# Altium project Main_Board.PrjPcb (part 44 of 44)
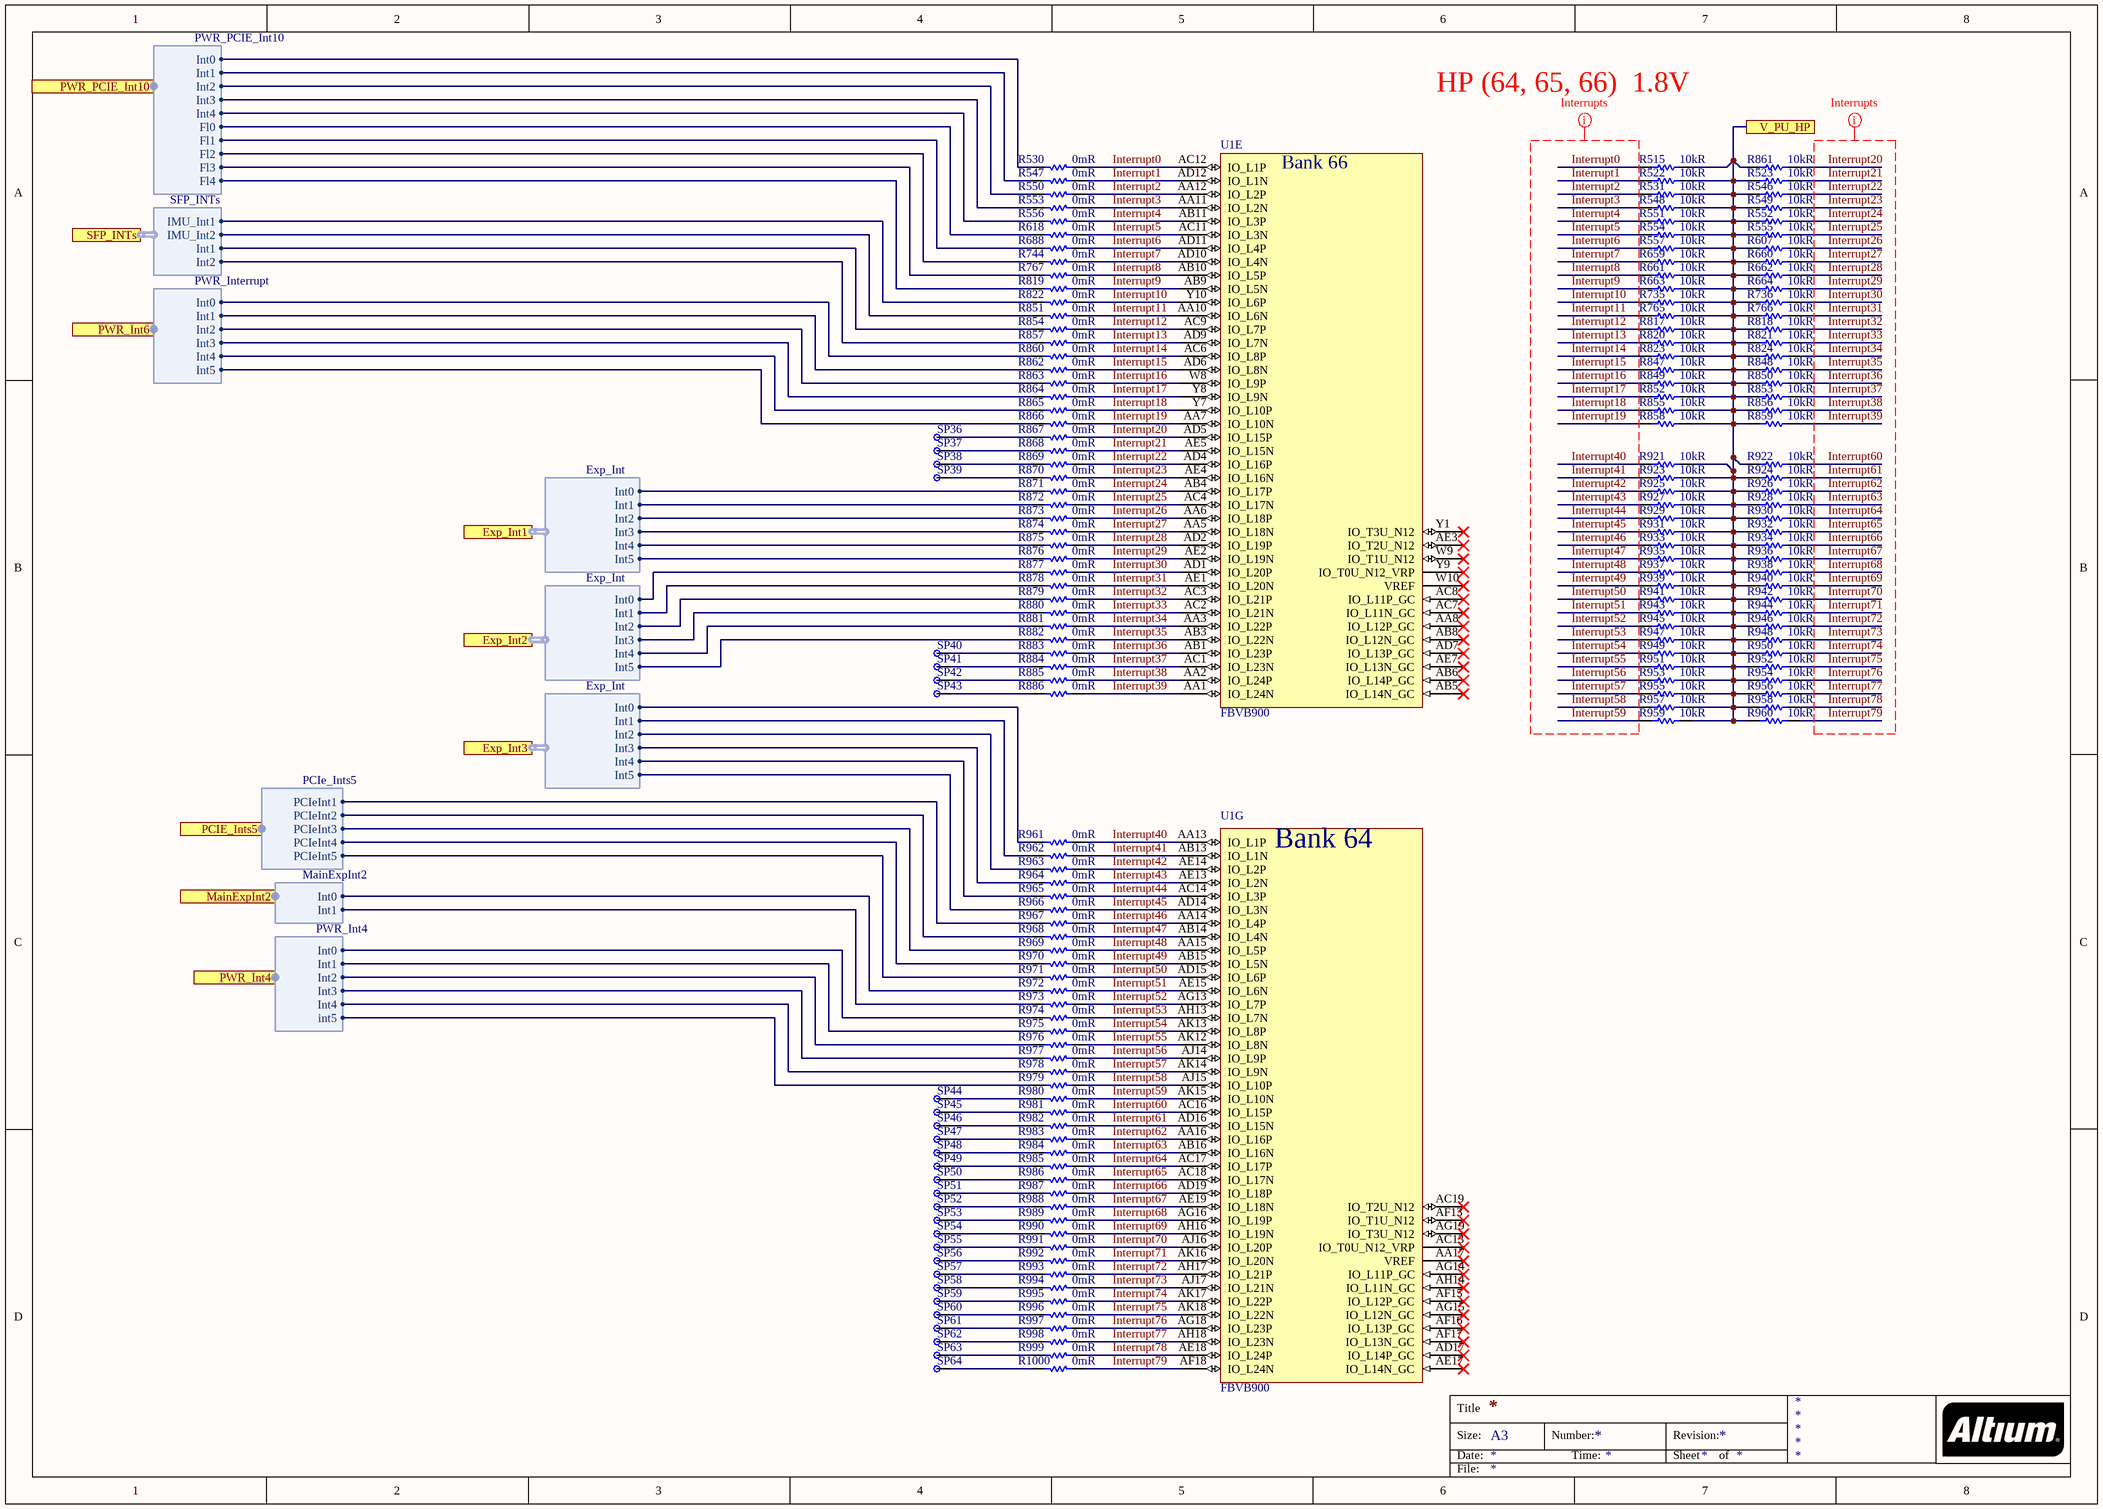
[diagram p71: US_Interrupts.SchDoc]

## Nets that join several sheets (continued)
NetR760_2: Expander_RESET (R760.2 R761.1), U_Expander_RESET/I2C_Expander_Main_Rst (U35_I2C_Expander_Main_Rst.12)
NetR762_2: Expander_RESET (R762.2 R763.1), U_Expander_RESET/I2C_Expander_Main_Rst (U35_I2C_Expander_Main_Rst.11)
NetR860_2: PowerDistribition/HiCurrent/U_Pomiar_pradu_napiecia_3 (U64_U_Pomiar_pradu_napiecia_3.3), US_Interrupts (R860.2)
NetR862_2: PowerDistribition/HiCurrent/U_Pomiar_pradu_napiecia_4 (U64_U_Pomiar_pradu_napiecia_4.3), US_Interrupts (R862.2)
NetR863_2: PowerDistribition/HiCurrent/U_Pomiar_pradu_napiecia_5 (U64_U_Pomiar_pradu_napiecia_5.3), US_Interrupts (R863.2)
NetR864_2: PowerDistribition/HiCurrent/U_Pomiar_pradu_napiecia_6 (U64_U_Pomiar_pradu_napiecia_6.3), US_Interrupts (R864.2)
NetR865_2: Power_Hi_Curr (U18.A3), US_Interrupts (R865.2)
NetR866_2: Pomiar_napiecia_high_curr (U72.3), US_Interrupts (R866.2)
NetR918_2: Ultrascale+_02 (R918.2), Trans_LS_I2C0 (U36_Trans_LS_I2C0.8)
NetR919_2: Ultrascale+_02 (R919.2), Trans_LS_I2C1 (U36_Trans_LS_I2C1.8)
NetSP12_I2C_Bridge_GPIO_1: Ext_GPIO/I2C_Bridge_GPIO (SP12_I2C_Bridge_GPIO.1 U3_I2C_Bridge_GPIO.24), U_Expander_RESET/I2C_Expander_Main_Rst (U35_I2C_Expander_Main_Rst.3)
NetU24_SPI_bridge_Main_12: HighSpeed/SPI_bridge_PCIe (5 pins), SPI_bridge_Main (U24_SPI_bridge_Main.12)
NetU24_SPI_bridge_Main_13: HighSpeed/SPI_bridge_PCIe (5 pins), SPI_bridge_Main (U24_SPI_bridge_Main.13)
NetU24_SPI_bridge_Main_14: HighSpeed/SPI_bridge_PCIe (5 pins), SPI_bridge_Main (U24_SPI_bridge_Main.14)
NVMe_Rx_0_N: Sata (J27.47 R541.2), GTR (C677.2)
NVMe_Rx_0_P: Sata (J27.49 R541.1), GTR (C653.2)
NVMe_Rx_1_N: Sata (J27.35 R542.1), GTR (C716.2)
NVMe_Rx_1_P: Sata (J27.37 R542.2), GTR (C715.2)
NVMe_Tx_0_N: Sata (J27.41), GTR (C651.2)
NVMe_Tx_0_P: Sata (J27.43), GTR (C649.2)
NVMe_Tx_1_N: Sata (J27.29), GTR (C718.2)
NVMe_Tx_1_P: Sata (J27.31), GTR (C717.2)
OSC_500Out: System_CLK (TP20.1), DAC (X2.10), CLK_Mux (C333.1)
P4HS_PowerAlert_Pcie0: HighSpeed/Power4HighSpeed/U_Pomiar_pradu_napiecia_PCIe0 (U64_U_Pomiar_pradu_napiecia_PCIe0.3), US_Interrupts (R530.2)
P4HS_PowerAlert_Pcie1: HighSpeed/Power4HighSpeed/U_Pomiar_pradu_napiecia_PCIe1 (U64_U_Pomiar_pradu_napiecia_PCIe1.3), US_Interrupts (R547.2)
P4HS_PowerAlert_Pcie2: HighSpeed/Power4HighSpeed/U_Pomiar_pradu_napiecia_PCIe2 (U64_U_Pomiar_pradu_napiecia_PCIe2.3), US_Interrupts (R550.2)
P4HS_PowerAlert_Pcie3: HighSpeed/Power4HighSpeed/U_Pomiar_pradu_napiecia_PCIe3 (U64_U_Pomiar_pradu_napiecia_PCIe3.3), US_Interrupts (R553.2)
P4HS_PowerAlert_Pcie4: HighSpeed/Power4HighSpeed/U_Pomiar_pradu_napiecia_PCIe4 (U64_U_Pomiar_pradu_napiecia_PCIe4.3), US_Interrupts (R556.2)
PCIe_RESET: Ultrascale+_01 (R788.1 TP35.1), Sata (J27.50)
PG1_1: Power_Distribution (R835.1), Power_ADP1850_Dual (R295.2 U37.27)
PG1_2: Power_Distribution (R838.1), Power_ADP1850_Dual_1 (R313.2 U38.27)
PG1_TPS7A8801: TPS7A88_5V_Dual_3.3V_3.3V (R440.2 U61.17), PowerDistribition/Zasilanie CLK/I2C_Expander_PWR_CLK (U35_I2C_Expander_PWR_CLK.28)
PG2_2: Power_Distribution (R836.1), Power_ADP1850_Dual_1 (R314.2 U38.14)
PG2_TPS7A8801: TPS7A88_5V_Dual_3.3V_3.3V (R441.2 U61.9), PowerDistribition/Zasilanie CLK/I2C_Expander_PWR_CLK (U35_I2C_Expander_PWR_CLK.1)
PG2_TPS7A8801_0V9: Power_ADP1850_Dual (U37.8), TPS7A88_3V3_1V8_0V9V@2x1A (R676.2 U70.9), ST1L08_5V_0V6 (U73.5), Power_LED (T33.1)
PG_2V5@1.5A: Power_Hi_Curr (U18.A2), Power_Ethernet (R392.1 U49.5), Power_LED (T38.1)
PG_3V3@14A_EXP: Power_Distribution (R835.2 R837.1), PowerDistribition/I2C_Expander_PWR_Dist (U35_I2C_Expander_PWR_Dist.25), Power_LED (T37.1)
PG_5V@10A_EXP: Power_Distribution (R836.2 R839.1), PowerDistribition/I2C_Expander_PWR_Dist (U35_I2C_Expander_PWR_Dist.26), Power_LED (T41.1)
PG_12@8A_EXP: Power_Distribution (R838.2 R840.1), PowerDistribition/I2C_Expander_PWR_Dist (U35_I2C_Expander_PWR_Dist.27), Power_LED (T45.1)
PG_48_20V: PowerDistribition/I2C_Expander_PWR_Dist (U35_I2C_Expander_PWR_Dist.4), Power_48_20V@3A (U65.19), Power_LED (T49.1), GPIO_I2C (R828.2)
PG_ADP1850_1V2_REG4: ADP1741_3V3_0V85 (R435.1 R668.1 U69.4), Power_LED (T40.1)
PG_LT3042: LT3042_12V_5V_LNLDO (R442.1 U62.4), PowerDistribition/Zasilanie CLK/I2C_Expander_PWR_CLK (U35_I2C_Expander_PWR_CLK.25), Power_LED (R1082.1)
PG_PS_LTC6952_1: PowerDistribition/Zasilanie CLK/5to3V3_1 (R431_5to3V3_1.1 U59_5to3V3_1.5), PowerDistribition/Zasilanie CLK/I2C_Expander_PWR_CLK (U35_I2C_Expander_PWR_CLK.17), Power_LED (T32.1)
PG_PS_LTC6952_2: PowerDistribition/Zasilanie CLK/5to3V3_2 (R431_5to3V3_2.1 U59_5to3V3_2.5), PowerDistribition/Zasilanie CLK/I2C_Expander_PWR_CLK (U35_I2C_Expander_PWR_CLK.21), Power_LED (T47.1)
PGND: Power_48_20V@3A (17 pins), RJ45 (D3.2 D4.2 R324.1)
Power1_In: Power_Distribution (P8.1), PowerDistribition/U_Pomiar_pradu_napiecia_1 (R448_U_Pomiar_pradu_napiecia_1.1 U64_U_Pomiar_pradu_napiecia_1.10)
Power1_In_CM: Power_Switch (9 pins), PowerDistribition/U_Pomiar_pradu_napiecia_1 (R448_U_Pomiar_pradu_napiecia_1.2 U64_U_Pomiar_pradu_napiecia_1.8 U64_U_Pomiar_pradu_napiecia_1.9)
Power2_In: Power_Distribution (P10.1), PowerDistribition/U_Pomiar_pradu_napiecia_2 (R448_U_Pomiar_pradu_napiecia_2.1 U64_U_Pomiar_pradu_napiecia_2.10)
Power2_In_CM: Power_Switch (9 pins), PowerDistribition/U_Pomiar_pradu_napiecia_2 (R448_U_Pomiar_pradu_napiecia_2.2 U64_U_Pomiar_pradu_napiecia_2.8 U64_U_Pomiar_pradu_napiecia_2.9)
Power_3.3_1: Zasilanie_CLKDistribution (20 pins), TPS7A88_5V_Dual_3.3V_3.3V (6 pins)
Power_3.3_2: Zasilanie_CLKDistribution (10 pins), TPS7A88_5V_Dual_3.3V_3.3V (6 pins)
Power_MUX_Status0: Power_Switch (R630.2 U5.9), PowerDistribition/I2C_Expander_PWR_Dist (U35_I2C_Expander_PWR_Dist.22)
Power_MUX_Status1: Power_Switch (R11.1 U4.9), PowerDistribition/I2C_Expander_PWR_Dist (U35_I2C_Expander_PWR_Dist.23)
Power_MUX_Status2: Power_Switch (R13.2 U48.9), PowerDistribition/I2C_Expander_PWR_Dist (U35_I2C_Expander_PWR_Dist.24)
PS_MODE1: PS_Config (P2.3 R350.1 S1.2 U1.R19), USB3 (U74.2)
PS_POR: PS_Config (P3.2 R355.2 U1.N19), RJ45 (U76.1), FTDI (U77.6), USB3 (U74.1)
PS_Reset: PS_Config (P4.1 R354.1 U1.P20), FTDI (U77.4 U78.6)
PWR_ExtIO_INT0: PowerDistribition/I2C_Expander_PWR_Dist (U35_I2C_Expander_PWR_Dist.16), US_Interrupts (R977.2)
PWR_ExtIO_INT1: PowerDistribition/I2C_Expander_PWR_Dist (U35_I2C_Expander_PWR_Dist.15), US_Interrupts (R976.2)
PWR_ExtIO_INT2: PowerDistribition/Zasilanie CLK/I2C_Expander_PWR_CLK (U35_I2C_Expander_PWR_CLK.15), US_Interrupts (R978.2)
PWR_ExtIO_INT3: PowerDistribition/Zasilanie CLK/I2C_Expander_PWR_CLK (U35_I2C_Expander_PWR_CLK.16), US_Interrupts (R979.2)
PWR_ExtIO_nReset: PowerDistribition/I2C_Expander_PWR_Dist (U35_I2C_Expander_PWR_Dist.14), Expander_RESET (R755.1), U_Expander_RESET/I2C_Expander_Main_Rst (U35_I2C_Expander_Main_Rst.27)
PWR_OUT_20V: Power_Switch (18 pins), Power_Hi_Curr (R266.2), HI_Curr_ADP1850 (29 pins), Power_ADP1850_Dual (21 pins), Power_ADP1850_Dual_1 (21 pins)
PWR_PowerAlert0: PowerDistribition/I2C_Expander_PWR_Dist (U35_I2C_Expander_PWR_Dist.17), PowerDistribition/U_Pomiar_pradu_napiecia_1 (U64_U_Pomiar_pradu_napiecia_1.3), US_Interrupts (R974.2)
PWR_PowerAlert1: PowerDistribition/I2C_Expander_PWR_Dist (U35_I2C_Expander_PWR_Dist.18), PowerDistribition/U_Pomiar_pradu_napiecia_2 (U64_U_Pomiar_pradu_napiecia_2.3), US_Interrupts (R975.2)
PWR_Switch1_En: Power_Switch (U6.A2), PowerDistribition/I2C_Expander_PWR_Dist (U35_I2C_Expander_PWR_Dist.28)
PWR_Switch1_Flag: Power_Switch (R29.1 U6.A3), PowerDistribition/I2C_Expander_PWR_Dist (U35_I2C_Expander_PWR_Dist.1)
PWR_Switch2_En: Power_Switch (U7.A2), PowerDistribition/I2C_Expander_PWR_Dist (U35_I2C_Expander_PWR_Dist.2)
PWR_Switch2_Flag: Power_Switch (R30.1 U7.A3), PowerDistribition/I2C_Expander_PWR_Dist (U35_I2C_Expander_PWR_Dist.3)
RAM_DDR4_VTT: RAM (25 pins), ST1L08_5V_0V6 (C722.2 C723.2 R689.1 U73.8)
RAM_Vcc1V2: Power_ADP1850_Dual (R297.1), PowerDistribition/HiCurrent/U_Pomiar_pradu_napiecia_4 (R448_U_Pomiar_pradu_napiecia_4.2 U64_U_Pomiar_pradu_napiecia_4.8 U64_U_Pomiar_pradu_napiecia_4.9), RAM_Power (128 pins), XilinxPower (16 pins), FPGA_Decoupling (C741.2 C760.1 C761.2), RAM (C36.2 R58.2)
RF_SYSREF_TO_FPGA_N: Ultrascale+_02 (U1.AK11), HighSpeed/PCIE0 (J1_PCIE0.48)
RF_SYSREF_TO_FPGA_N: Ultrascale+_02 (U1.AG10), HighSpeed/PCIE1 (J1_PCIE1.48)
RF_SYSREF_TO_FPGA_N: Ultrascale+_02 (U1.AH9), HighSpeed/PCIE2 (J1_PCIE2.48)
RF_SYSREF_TO_FPGA_N: Ultrascale+_02 (U1.AE9), HighSpeed/PCIE3 (J1_PCIE3.48)
RF_SYSREF_TO_FPGA_N: Ultrascale+_02 (U1.AK5), HighSpeed/PCIE4 (J1_PCIE4.48)
RF_SYSREF_TO_FPGA_P: Ultrascale+_02 (U1.AJ11), HighSpeed/PCIE0 (J1_PCIE0.50)
RF_SYSREF_TO_FPGA_P: Ultrascale+_02 (U1.AF10), HighSpeed/PCIE1 (J1_PCIE1.50)
RF_SYSREF_TO_FPGA_P: Ultrascale+_02 (U1.AJ9), HighSpeed/PCIE2 (J1_PCIE2.50)
RF_SYSREF_TO_FPGA_P: Ultrascale+_02 (U1.AE8), HighSpeed/PCIE3 (J1_PCIE3.50)
RF_SYSREF_TO_FPGA_P: Ultrascale+_02 (U1.AJ5), HighSpeed/PCIE4 (J1_PCIE4.50)
RST_brigde: SFP_Group+IMU/I2C_Bridge_SFP (SP12_I2C_Bridge_SFP.1 U3_I2C_Bridge_SFP.24), Expander_RESET (R757.1), U_Expander_RESET/I2C_Expander_Main_Rst (U35_I2C_Expander_Main_Rst.1)
SetClk_Si53323_2: CLK_Mux (T36.1), Ultrascale+_02 (R900.2)
SFP0_LOS: SFP (J32.8 R66.1), SFP_Group+IMU/I2C_Expander_SFP (U35_I2C_Expander_SFP.4)
SFP0_Rx_N: SFP (J32.19), bank226 (C57#2.2 R706#2.2)
SFP0_Rx_P: SFP (J32.18), bank226 (C57#2.1 R705#2.2)
SFP0_Tx_N: SFP (J32.12), bank226 (C42.2 R704#2.2)
SFP0_Tx_P: SFP (J32.13), bank226 (C42.1 R703#2.2)
SFP0_TxDis: SFP (J32.3 R68.1), SFP_Group+IMU/I2C_Expander_SFP (U35_I2C_Expander_SFP.3)
SFP0_TxF: SFP (J32.2 R67.1), SFP_Group+IMU/I2C_Expander_SFP (U35_I2C_Expander_SFP.2)
SFP1_LOS: SFP1 (J33.8 R136.1), SFP_Group+IMU/I2C_Expander_SFP (U35_I2C_Expander_SFP.24)
SFP1_Rx_N: SFP1 (J33.19), bank226 (C68#2.2 R830#2.2)
SFP1_Rx_P: SFP1 (J33.18), bank226 (C68#2.1 R829#2.2)
SFP1_Tx_N: SFP1 (J33.12), bank226 (C58#2.2 R708#2.2)
SFP1_Tx_P: SFP1 (J33.13), bank226 (C58#2.1 R707#2.2)
SFP1_TxDis: SFP1 (J33.3 R138.1), SFP_Group+IMU/I2C_Expander_SFP (U35_I2C_Expander_SFP.23)
SFP1_TxF: SFP1 (J33.2 R137.1), SFP_Group+IMU/I2C_Expander_SFP (U35_I2C_Expander_SFP.22)
SFP2_LOS: SFP2 (J34.8 R146.1), SFP_Group+IMU/I2C_Expander_SFP (U35_I2C_Expander_SFP.27)
SFP2_Rx_N: SFP2 (J34.19), bank226 (C113#2.2 R834#2.2)
SFP2_Rx_P: SFP2 (J34.18), bank226 (C113#2.1 R833#2.2)
SFP2_Tx_N: SFP2 (J34.12), bank226 (C69#2.2 R832#2.2)
SFP2_Tx_P: SFP2 (J34.13), bank226 (C69#2.1 R831#2.2)
SFP2_TxDis: SFP2 (J34.3 R148.1), SFP_Group+IMU/I2C_Expander_SFP (U35_I2C_Expander_SFP.26)
SFP2_TxF: SFP2 (J34.2 R147.1), SFP_Group+IMU/I2C_Expander_SFP (U35_I2C_Expander_SFP.25)
SFP3_LOS: SFP3 (J35.8 R156.1), SFP_Group+IMU/I2C_Expander_SFP (U35_I2C_Expander_SFP.19)
SFP3_Rx_N: SFP3 (J35.19), bank226 (C117#2.2 R844#2.2)
SFP3_Rx_P: SFP3 (J35.18), bank226 (C117#2.1 R843#2.2)
SFP3_Tx_N: SFP3 (J35.12), bank226 (C114#2.2 R842#2.2)
SFP3_Tx_P: SFP3 (J35.13), bank226 (C114#2.1 R841#2.2)
SFP3_TxDis: SFP3 (J35.3 R158.1), SFP_Group+IMU/I2C_Expander_SFP (U35_I2C_Expander_SFP.18)
SFP3_TxF: SFP3 (J35.2 R157.1), SFP_Group+IMU/I2C_Expander_SFP (U35_I2C_Expander_SFP.17)
SFP_I2C4.SCL: WR_Clock (R130.2), SFP_Group+IMU/I2C_Bridge_SFP (R9_I2C_Bridge_SFP.2 SP11_I2C_Bridge_SFP.1 U3_I2C_Bridge_SFP.11), IMU (U58.13)
SFP_I2C4.SDA: WR_Clock (R131.2), SFP_Group+IMU/I2C_Bridge_SFP (R10_I2C_Bridge_SFP.2 SP10_I2C_Bridge_SFP.1 U3_I2C_Bridge_SFP.10), IMU (U58.14)
SFP_I2C5.SCL: Power_Distribution (R457.2 R465.2 R593.2 R597.2), Power_Hi_Curr (10 pins), PowerDistribition/HiCurrent/U_Pomiar_pradu_napiecia_3 (U64_U_Pomiar_pradu_napiecia_3.5), PowerDistribition/HiCurrent/U_Pomiar_pradu_napiecia_4 (U64_U_Pomiar_pradu_napiecia_4.5), PowerDistribition/HiCurrent/U_Pomiar_pradu_napiecia_5 (U64_U_Pomiar_pradu_napiecia_5.5), PowerDistribition/HiCurrent/U_Pomiar_pradu_napiecia_6 (U64_U_Pomiar_pradu_napiecia_6.5), Pomiar_napiecia_high_curr (U72.5), PowerDistribition/Zasilanie CLK/I2C_Expander_PWR_CLK (U35_I2C_Expander_PWR_CLK.8), PowerDistribition/I2C_Expander_PWR_Dist (U35_I2C_Expander_PWR_Dist.8), PowerDistribition/U_Pomiar_pradu_napiecia_1 (U64_U_Pomiar_pradu_napiecia_1.5), PowerDistribition/U_Pomiar_pradu_napiecia_2 (U64_U_Pomiar_pradu_napiecia_2.5), SFP_Group+IMU/I2C_Bridge_SFP (R7_I2C_Bridge_SFP.2 SP14_I2C_Bridge_SFP.1 U3_I2C_Bridge_SFP.13)
SFP_I2C5.SDA: Power_Distribution (R459.2 R466.2 R594.2 R598.2), Power_Hi_Curr (10 pins), PowerDistribition/HiCurrent/U_Pomiar_pradu_napiecia_3 (U64_U_Pomiar_pradu_napiecia_3.4), PowerDistribition/HiCurrent/U_Pomiar_pradu_napiecia_4 (U64_U_Pomiar_pradu_napiecia_4.4), PowerDistribition/HiCurrent/U_Pomiar_pradu_napiecia_5 (U64_U_Pomiar_pradu_napiecia_5.4), PowerDistribition/HiCurrent/U_Pomiar_pradu_napiecia_6 (U64_U_Pomiar_pradu_napiecia_6.4), Pomiar_napiecia_high_curr (U72.4), PowerDistribition/Zasilanie CLK/I2C_Expander_PWR_CLK (U35_I2C_Expander_PWR_CLK.9), PowerDistribition/I2C_Expander_PWR_Dist (U35_I2C_Expander_PWR_Dist.9), PowerDistribition/U_Pomiar_pradu_napiecia_1 (U64_U_Pomiar_pradu_napiecia_1.4), PowerDistribition/U_Pomiar_pradu_napiecia_2 (U64_U_Pomiar_pradu_napiecia_2.4), SFP_Group+IMU/I2C_Bridge_SFP (R8_I2C_Bridge_SFP.2 SP13_I2C_Bridge_SFP.1 U3_I2C_Bridge_SFP.12)
SFP_I2C6.SCL: HighSpeed/I2C_Bridge_PCIE (U3_I2C_Bridge_PCIE.19), SFP_Group+IMU/I2C_Bridge_SFP (R5_I2C_Bridge_SFP.2 SP16_I2C_Bridge_SFP.1 U3_I2C_Bridge_SFP.15)
SFP_I2C6.SDA: HighSpeed/I2C_Bridge_PCIE (U3_I2C_Bridge_PCIE.20), SFP_Group+IMU/I2C_Bridge_SFP (R6_I2C_Bridge_SFP.2 SP15_I2C_Bridge_SFP.1 U3_I2C_Bridge_SFP.14)
SFP_I2C7.SCL: SFP_Group+IMU/I2C_Bridge_SFP (R3_I2C_Bridge_SFP.2 SP18_I2C_Bridge_SFP.1 U3_I2C_Bridge_SFP.17), SFP_Group+IMU/I2C_Expander_SFP (U35_I2C_Expander_SFP.8)
SFP_I2C7.SDA: SFP_Group+IMU/I2C_Bridge_SFP (R4_I2C_Bridge_SFP.2 SP17_I2C_Bridge_SFP.1 U3_I2C_Bridge_SFP.16), SFP_Group+IMU/I2C_Expander_SFP (U35_I2C_Expander_SFP.9)
SFP_INT0: SFP_Group+IMU/I2C_Expander_SFP (U35_I2C_Expander_SFP.16), US_Interrupts (R854.2)
SFP_INT1: SFP_Group+IMU/I2C_Expander_SFP (U35_I2C_Expander_SFP.15), US_Interrupts (R857.2)
SFP_IO_nReset: SFP_Group+IMU/I2C_Expander_SFP (U35_I2C_Expander_SFP.14), Expander_RESET (R756.1), U_Expander_RESET/I2C_Expander_Main_Rst (U35_I2C_Expander_Main_Rst.28)
SGMI_C_Rx_N: RJ45 (C484.2), GTR (U1.G26)
SGMI_C_Rx_P: RJ45 (C483.2), GTR (U1.G25)
SGMI_C_Tx_N: RJ45 (C482.2), GTR (U1.G29)
SGMI_C_Tx_P: RJ45 (C479.2), GTR (U1.G30)
Si53323_1_Q2_LVDS_N: CLK_Mux (C725.1 R386.2 R387.2), Ultrascale+_02 (U1.AG3)
Si53323_1_Q2_LVDS_P: CLK_Mux (C724.1 R100.2 R125.2), Ultrascale+_02 (U1.AG4)
Si53323_2_Q1_N: CLK_Mux (U32.10), LTC6952 (C44.2 R79.2)
Si53323_2_Q1_P: CLK_Mux (U32.9), LTC6952 (C43.2 R76.1)
Si53323_2_Q2_LVDS_N: CLK_Mux (C727.1 R486.2 R487.2), Ultrascale+_02 (U1.A16)
Si53323_2_Q2_LVDS_P: CLK_Mux (C726.1 R427.2 R538.2), Ultrascale+_02 (U1.A17)
SPI1_CLK: Ultrascale+_01 (J25.1 R803.1), Ultrascale+_02 (U15.14), SPI_bridge_Main (5 pins)
SPI1_CS: Ultrascale+_01 (J25.4 R123.1 R806.1), Ultrascale+_02 (R124.1 U15.11), SPI_bridge_Main (5 pins)
SPI1_MISO: Ultrascale+_01 (J25.3 R807.1), Ultrascale+_02 (U15.13), SPI_bridge_Main (5 pins)
SPI1_MOSI: Ultrascale+_01 (J25.2 R808.1), Ultrascale+_02 (U15.12), SPI_bridge_Main (5 pins)
SPI_DAC_CS: DAC (U30.14), SPI_bridge_Main (R238_SPI_bridge_Main.1 SP27_SPI_bridge_Main.1 U27_SPI_bridge_Main.11)
SYNC_N: Ultrascale+_02 (U1.AK10), HighSpeed/PCIE0 (J1_PCIE0.12)
SYNC_N: Ultrascale+_02 (U1.AK8), HighSpeed/PCIE1 (J1_PCIE1.12)
SYNC_N: Ultrascale+_02 (U1.AF7), HighSpeed/PCIE2 (J1_PCIE2.12)
SYNC_N: Ultrascale+_02 (U1.AK6), HighSpeed/PCIE3 (J1_PCIE3.12)
SYNC_N: Ultrascale+_02 (U1.AK4), HighSpeed/PCIE4 (J1_PCIE4.12)
SYNC_P: Ultrascale+_02 (U1.AJ10), HighSpeed/PCIE0 (J1_PCIE0.14)
SYNC_P: Ultrascale+_02 (U1.AK9), HighSpeed/PCIE1 (J1_PCIE1.14)
SYNC_P: Ultrascale+_02 (U1.AF8), HighSpeed/PCIE2 (J1_PCIE2.14)
SYNC_P: Ultrascale+_02 (U1.AK7), HighSpeed/PCIE3 (J1_PCIE3.14)
SYNC_P: Ultrascale+_02 (U1.AJ4), HighSpeed/PCIE4 (J1_PCIE4.14)
uart0_RxD: Ultrascale+_01 (R779.1 TP32.1), FTDI (U57.12)
uart0_TxD: Ultrascale+_01 (R778.1 TP27.1), FTDI (U57.11)
uart1_RxD: Ultrascale+_01 (R776.1 TP31.1), FTDI (U57.13)
uart1_TxD: Ultrascale+_01 (R777.1 TP29.1), FTDI (U57.14)
US2_FTDI_UART1_RXD: Ultrascale+_02 (R910.2), FTDI (U79.13)
US2_FTDI_UART1_TXD: Ultrascale+_02 (R909.2), FTDI (U79.14)
US+_MGTVccAux: Ultrascale+_02 (7 pins), Power_Low_Curr (7 pins), XilinxPower (18 pins), FPGA_Decoupling (C756.2 C759.2), Trans_LS_I2C0 (U36_Trans_LS_I2C0.2), Trans_LS_I2C1 (U36_Trans_LS_I2C1.2), FTDI (U79.15), US_Interrupts (80 pins)
US+_Vcc_PS_Batt: XilinxPower (B1.1 R276.1 U1.U20), FPGA_Decoupling (C747.1 C748.2)
US+_Vcc_PS_DDR_504: Power_Low_Curr (9 pins), XilinxPower (7 pins), FPGA_Decoupling (C753.1 C754.2 C755.2)
US+_Vcc_PS_IntFp: HI_Curr_ADP1850 (R271.2), Pomiar_napiecia_high_curr (R617.2 U72.8 U72.9), XilinxPower (53 pins), FPGA_Decoupling (11 pins)
US_PS_JTAG_TCK: PS_Config (R346.2 U1.L19), FTDI (R1028.2)
US_PS_JTAG_TDI: PS_Config (R347.2 U1.L20), FTDI (R1026.2)
US_PS_JTAG_TDO: PS_Config (U1.M20), FTDI (R1029.2)
US_PS_JTAG_TMS: PS_Config (R348.2 U1.L21), FTDI (R1027.2)
USB2_CLK: Ultrascale+_01 (R362.2), USB3 (U45.1)
USB2_D0: Ultrascale+_01 (R116.2), USB3 (U45.3)
USB2_D1: Ultrascale+_01 (R117.2), USB3 (U45.4)
USB2_D2: Ultrascale+_01 (R115.2), USB3 (U45.5)
USB2_D3: Ultrascale+_01 (R119.2), USB3 (U45.6)
USB2_D4: Ultrascale+_01 (R120.2), USB3 (U45.7)
USB2_D5: Ultrascale+_01 (R121.2), USB3 (U45.9)
USB2_D6: Ultrascale+_01 (R122.2), USB3 (U45.10)
USB2_D7: Ultrascale+_01 (R802.1), USB3 (U45.13)
USB2_DIR: Ultrascale+_01 (R800.1), USB3 (U45.31)
USB2_NXT: Ultrascale+_01 (R801.1), USB3 (U45.2)
USB2_STP: Ultrascale+_01 (R118.2), USB3 (U45.29)
USB_RX_N: USB3 (C543.2), GTR (U1.J25)
USB_RX_P: USB3 (C542.2), GTR (U1.J26)
USB_TX_N: USB3 (C541.2), GTR (U1.H28)
USB_TX_P: USB3 (C540.2), GTR (U1.H27)
uSD_CD: Ultrascale+_01 (R782.1), uSD (R381.1 R845#2.2 U47.D3)
uSD_CLK: Ultrascale+_01 (R96.2 R97.1), uSD (U47.C1)
uSD_CMD: Ultrascale+_01 (R95.2), uSD (U47.D2)
uSD_D0: Ultrascale+_01 (R87.2), uSD (U47.D1)
uSD_D1: Ultrascale+_01 (R88.2), uSD (U47.E1)
uSD_D2: Ultrascale+_01 (R89.2), uSD (U47.A1)
uSD_D3: Ultrascale+_01 (R90.2), uSD (U47.B1)
uSD_D4: Ultrascale+_01 (R91.1), uSD (U47.B2)
uSD_D5: Ultrascale+_01 (R92.1), uSD (U47.A2)
uSD_D6: Ultrascale+_01 (R93.1), uSD (U47.A3)
uSD_D7: Ultrascale+_01 (R94.1), uSD (U47.E3)
V_PoE+: Power_48_20V@3A (6 pins), RJ45 (D3.1 D4.1 R324.2)
VDD_DIG: WR_Clock (7 pins), Zasilanie_CLKDistribution (C93.1 C165.2 FB21.2 U16.8)
Vout1_1: Power_ADP1850_Dual (13 pins), PowerDistribition/HiCurrent/U_Pomiar_pradu_napiecia_3 (R448_U_Pomiar_pradu_napiecia_3.1 U64_U_Pomiar_pradu_napiecia_3.10)
Vout1_2: Power_ADP1850_Dual_1 (13 pins), PowerDistribition/HiCurrent/U_Pomiar_pradu_napiecia_5 (R448_U_Pomiar_pradu_napiecia_5.1 U64_U_Pomiar_pradu_napiecia_5.10)
Vout2_1: Power_ADP1850_Dual (13 pins), PowerDistribition/HiCurrent/U_Pomiar_pradu_napiecia_4 (R448_U_Pomiar_pradu_napiecia_4.1 U64_U_Pomiar_pradu_napiecia_4.10)
Vout2_2: Power_ADP1850_Dual_1 (13 pins), PowerDistribition/HiCurrent/U_Pomiar_pradu_napiecia_6 (R448_U_Pomiar_pradu_napiecia_6.1 U64_U_Pomiar_pradu_napiecia_6.10)
WR_LMK_CLK_RC_HF1_N: WR_Clock (C729.2 R1086.1), Ultrascale+_02 (U1.AJ1)
WR_LMK_CLK_RC_HF1_P: WR_Clock (C729.1 R1085.1), Ultrascale+_02 (U1.AJ2)
WR_LMK_CLK_RC_HF2_N: WR_Clock (C730.2 R1088.1), Ultrascale+_02 (U1.C17)
WR_LMK_CLK_RC_HF2_P: WR_Clock (C730.1 R1087.1), Ultrascale+_02 (U1.B16)

## Assembly variants
wr_i2c: not fitted R132 R403 R405 R407 R408 R412 R414 R416 R418 R637 R638 R641 R642 R723 R724 R727 R728
Standard: not fitted C587 R14 R14 R14 R16 R16 R16 R22 R22 R22 R69 R70 R71 R72 R73 R74 R100 R125 R126 R127 R127 R128 R128 R129 R129 R132 R133 R134 R140 R141 R142 R143 R144 R144 R151 R152 R153 R154 R161 R162 R163 R164 R175 R175 R176 R176 R177 R177 R178 R178 R179 R179 R180 R180 R183 R183 R185 R185 R186 R186 R187 R187 R188 R188 R189 R189 R192 R192 R193 R193 R194 R194 R196 R196 R197 R197 R198 R198 R201 R201 R202 R202 R204 R204 R205 R205 R206 R206 R207 R207 R211 R211 R213 R213 R215 R215 R217 R217 R219 R219 R222 R222 R230 R230 R242 R244 R246 R247 R248 R249 R250 R251 R256 R258 R259 R260 R261 R262 R264 R277 R278 R281 R281 R283 R286 R292 R294 R295 R296 R304 R304 R304 R312 R313 R314 R342 R343 R344 R344 R345 R345 R366 R366 R389 R389 R389 R390 R390 R390 R403 R405 R407 R408 R412 R414 R416 R418 R427 R446 R450 R451 R451 R453 R453 R456 R457 R457 R458 R458 R459 R459 R462 R462 R463 R463 R465 R465 R466 R466 R467 R467 R469 R469 R471 R471 R473 R473 R475 R475 R478 R479 R479 R492 R494 R494 R496 R497 R500 R501 R502 R504 R504 R508 R511 R512 R512 R516 R516 R518 R518 R520 R520 R525 R525 R526 R526 R528 R528 R538 R561 R561 R562 R562 R563 R563 R566 R566 R567 R567 R568 R568 R569 R569 R570 R570 R572 R572 R574 R574 R575 R575 R576 R576 R578 R578 R579 R579 R580 R580 R581 R581 R583 R583 R584 R584 R585 R585 R587 R587 R588 R588 R589 R589 R591 R591 R592 R592 R593 R593 R594 R594 R596 R596 R597 R597 R598 R598 R600 R629 R637 R638 R641 R642 R669 R696 R697 R697 R699 R700 R701 R701 R703 R706 R707 R723 R724 R727 R728 R738 R738 R740 R740 R742 R742 R758 R758 R760 R760 R763 U42